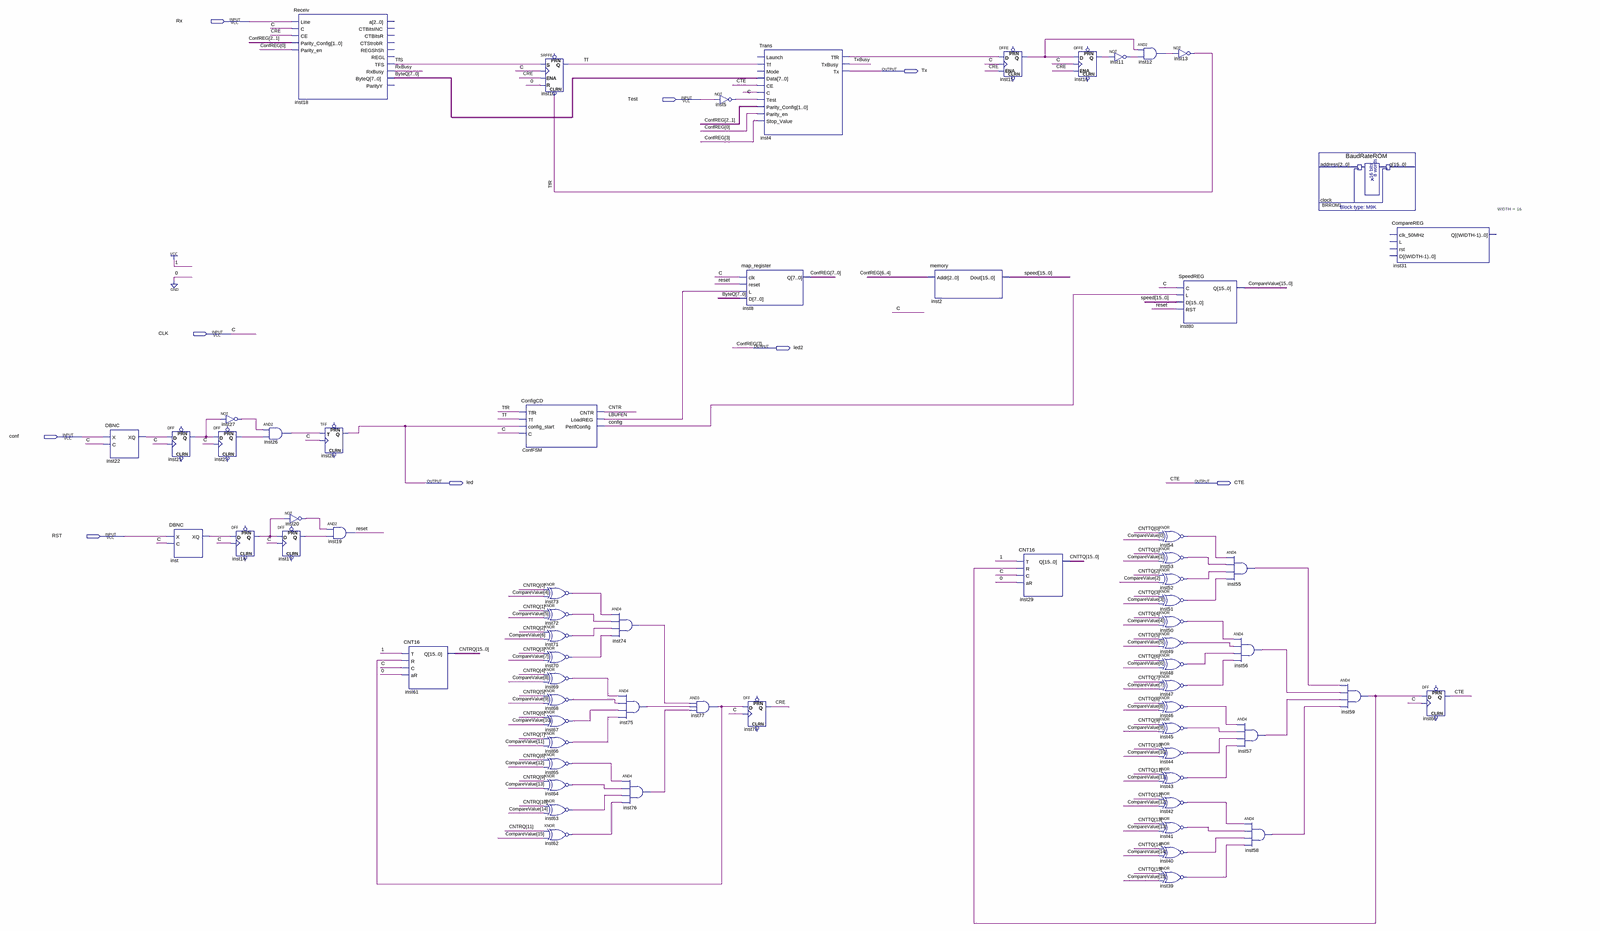
[diagram p0: schematic sheet, whole]
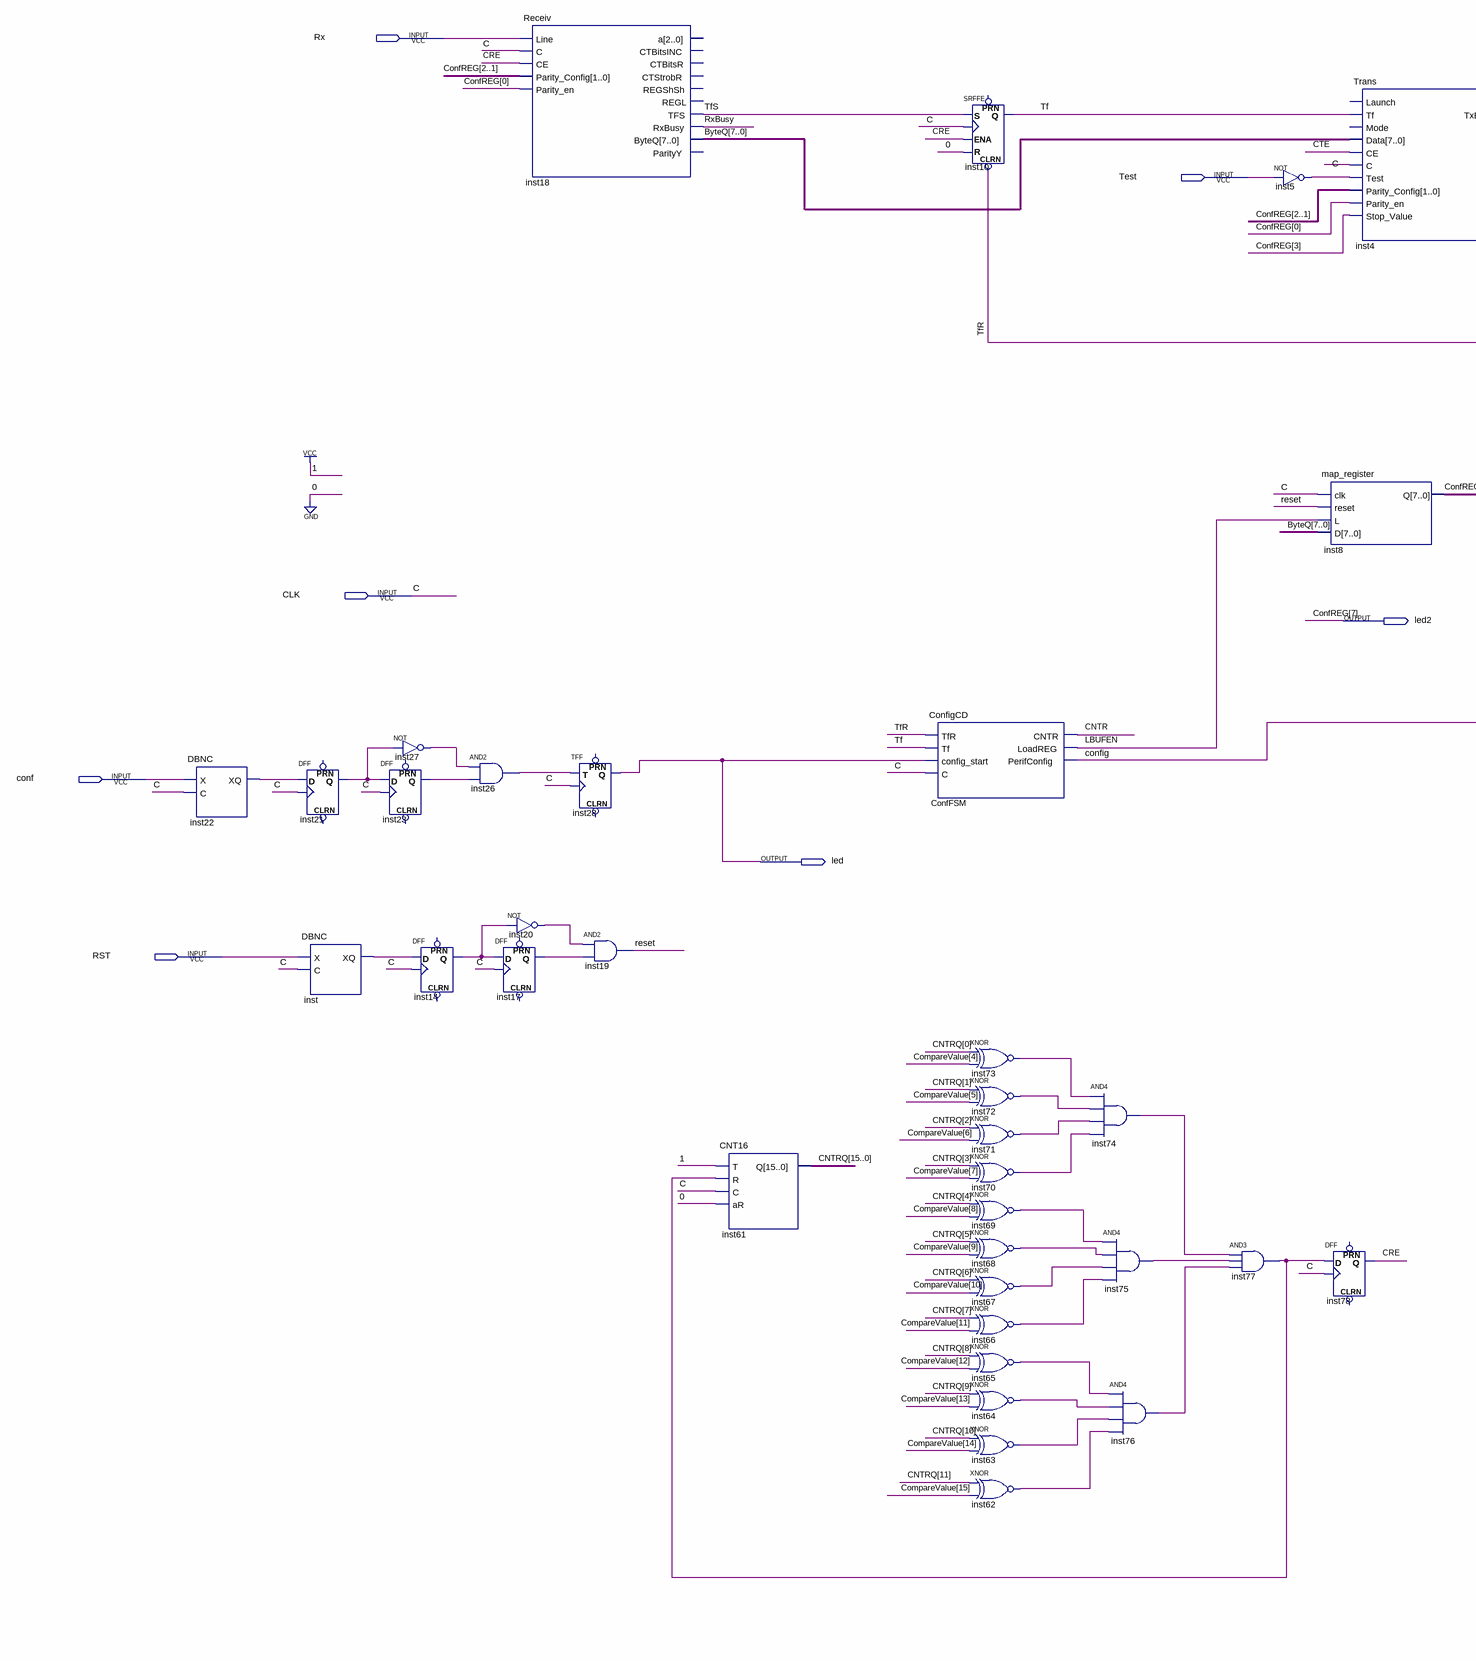
[diagram p1: schematic sheet, left part]
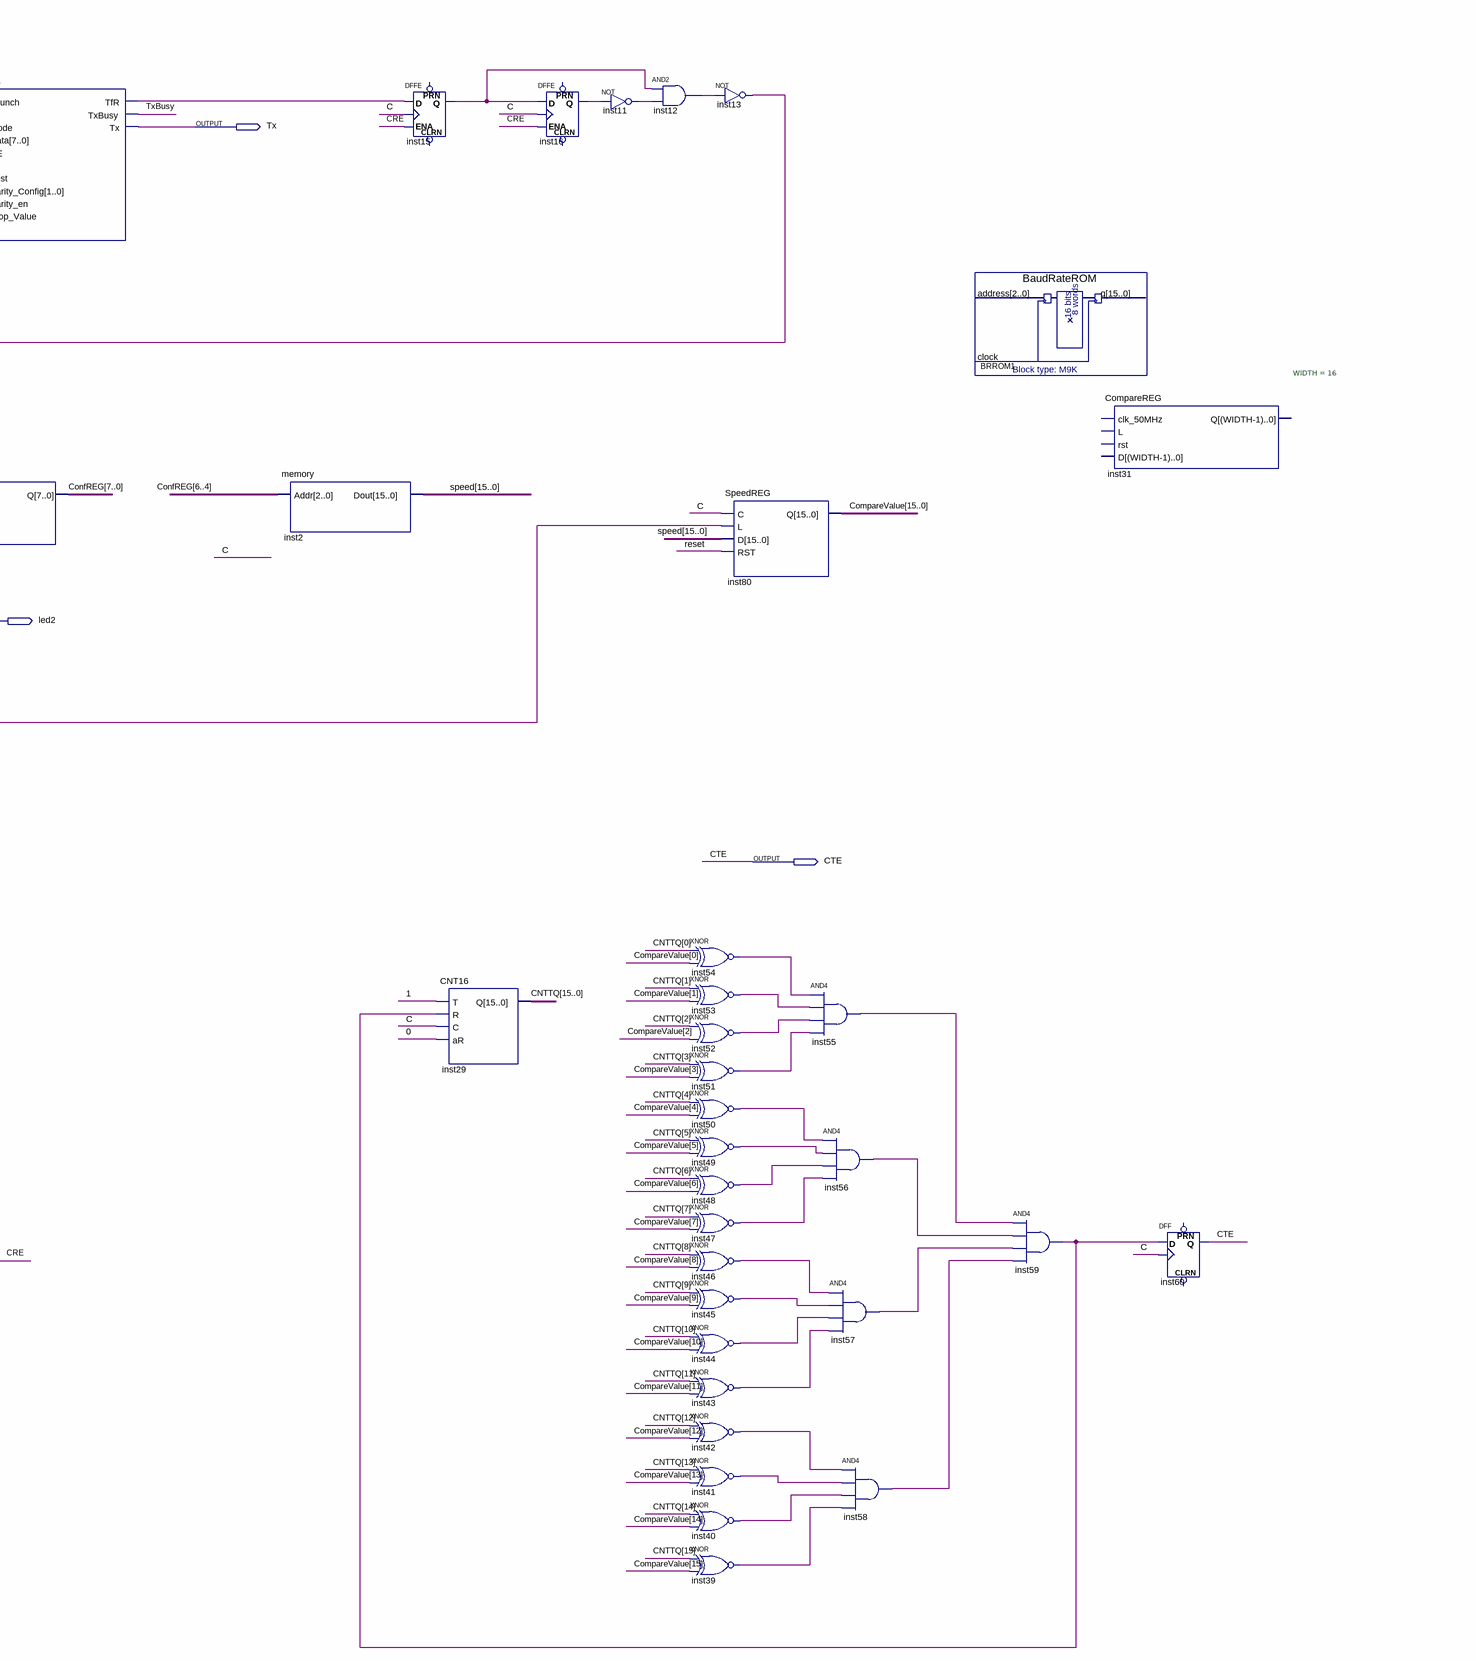
[diagram p2: schematic sheet, right part]
// Quartus schematic transmitter.bdf as structural Verilog: 67 symbols, 9 pins
module transmitter (
  input  Rx,
  input  Test,
  input  CLK,
  input  conf,
  input  RST,
  output Tx,
  output led2,
  output led,
  output CTE
);

  wire CNTR, \config , CRE, inst4_tfr, inst5_out, inst11_out, inst12_out, inst14_q, inst15_q, inst16_q,
       inst17_q, inst20_out, inst21_q, inst22_xq, inst23_q, inst26_out, inst27_out, inst39_out, inst40_out,
       inst41_out, inst42_out, inst43_out, inst44_out, inst45_out, inst46_out, inst47_out, inst48_out,
       inst49_out, inst50_out, inst51_out, inst52_out, inst53_out, inst54_out, inst55_out, inst56_out,
       inst57_out, inst58_out, inst59_out, inst62_out, inst63_out, inst64_out, inst65_out, inst66_out,
       inst67_out, inst68_out, inst69_out, inst70_out, inst71_out, inst72_out, inst73_out, inst74_out,
       inst75_out, inst76_out, inst77_out, inst_xq, LBUFEN, reset, RxBusy, Tf, TfR, TfS, TxBusy;
  wire [6:0] ConfREG;
  wire [7:0] ByteQ;
  wire [15:0] CNTRQ, CNTTQ, CompareValue, speed;

  DBNC inst22 (.X(conf), .C(CLK), .XQ(inst22_xq));
  DFF inst21 (.CLK(CLK), .D(inst22_xq), .Q(inst21_q));  // open: CLRN, PRN
  DBNC inst (.X(RST), .C(CLK), .XQ(inst_xq));
  not inst27 (inst27_out, inst21_q);
  DFF inst23 (.CLK(CLK), .D(inst21_q), .Q(inst23_q));  // open: CLRN, PRN
  DFF inst14 (.CLK(CLK), .D(inst_xq), .Q(inst14_q));  // open: CLRN, PRN
  and inst26 (inst26_out, inst27_out, inst23_q);
  Receiv inst18 (
    .Line(Rx), .C(CLK), .CE(CRE), .Parity_Config(ConfREG[2:1]), .Parity_en(ConfREG[0]), .TFS(TfS),
    .RxBusy(RxBusy), .ByteQ(ByteQ));  // open: a, CTBitsINC, CTBitsR, CTStrobR, REGShSh, REGL, ParityY
  not inst20 (inst20_out, inst14_q);
  DFF inst17 (.CLK(CLK), .D(inst14_q), .Q(inst17_q));  // open: CLRN, PRN
  TFF inst28 (.T(inst26_out), .CLK(CLK), .Q(led));  // open: PRN, CLRN
  and inst19 (reset, inst20_out, inst17_q);
  CNT16 inst61 (.T(1'b1), .R(inst77_out), .C(CLK), .aR(1'b0), .Q(CNTRQ));
  ConfigCD ConfFSM (
    .TfR(TfR), .Tf(Tf), .config_start(led), .C(CLK), .CNTR(CNTR), .LoadREG(LBUFEN), .PerifConfig(\config ));
  SRFFE inst10 (.S(TfS), .CLK(CLK), .CLRN(TfR), .R(1'b0), .ENA(CRE), .Q(Tf));  // open: PRN
  xnor inst73 (inst73_out, CNTRQ[0], CompareValue[4]);
  xnor inst72 (inst72_out, CNTRQ[1], CompareValue[5]);
  xnor inst71 (inst71_out, CNTRQ[2], CompareValue[6]);
  xnor inst70 (inst70_out, CNTRQ[3], CompareValue[7]);
  xnor inst69 (inst69_out, CNTRQ[4], CompareValue[8]);
  xnor inst68 (inst68_out, CNTRQ[5], CompareValue[9]);
  xnor inst67 (inst67_out, CNTRQ[6], CompareValue[10]);
  xnor inst66 (inst66_out, CNTRQ[7], CompareValue[11]);
  xnor inst65 (inst65_out, CNTRQ[8], CompareValue[12]);
  xnor inst64 (inst64_out, CNTRQ[9], CompareValue[13]);
  xnor inst63 (inst63_out, CNTRQ[10], CompareValue[14]);
  xnor inst62 (inst62_out, CNTRQ[11], CompareValue[15]);
  and inst74 (inst74_out, inst73_out, inst72_out, inst71_out, inst70_out);
  and inst75 (inst75_out, inst69_out, inst68_out, inst67_out, inst66_out);
  and inst76 (inst76_out, inst65_out, inst64_out, inst63_out, inst62_out);
  and inst77 (inst77_out, inst74_out, inst75_out, inst76_out);
  not inst5 (inst5_out, Test);
  map_register inst8 (.clk(CLK), .reset(reset), .L(LBUFEN), .D(ByteQ), .Q({led2, ConfREG}));
  DFF inst78 (.CLK(CLK), .D(inst77_out), .Q(CRE));  // open: CLRN, PRN
  Trans inst4 (
    .Tf(Tf), .Data(ByteQ), .CE(CTE), .C(CLK), .Test(inst5_out), .Parity_Config(ConfREG[2:1]),
    .Parity_en(ConfREG[0]), .Stop_Value(ConfREG[3]), .TfR(inst4_tfr), .TxBusy(TxBusy), .Tx(Tx));  // open: Launch, Mode
  memory inst2 (.Addr(ConfREG[6:4]), .Dout(speed));
  DFFE inst15 (.D(inst4_tfr), .CLK(CLK), .ENA(CRE), .Q(inst15_q));  // open: PRN, CLRN
  CNT16 inst29 (.T(1'b1), .R(inst59_out), .C(CLK), .aR(1'b0), .Q(CNTTQ));
  DFFE inst16 (.D(inst15_q), .CLK(CLK), .ENA(CRE), .Q(inst16_q));  // open: PRN, CLRN
  not inst11 (inst11_out, inst16_q);
  and inst12 (inst12_out, inst15_q, inst11_out);
  not inst13 (TfR, inst12_out);
  xnor inst54 (inst54_out, CNTTQ[0], CompareValue[0]);
  xnor inst53 (inst53_out, CNTTQ[1], CompareValue[1]);
  xnor inst52 (inst52_out, CNTTQ[2], CompareValue[2]);
  xnor inst51 (inst51_out, CNTTQ[3], CompareValue[3]);
  xnor inst50 (inst50_out, CNTTQ[4], CompareValue[4]);
  xnor inst49 (inst49_out, CNTTQ[5], CompareValue[5]);
  xnor inst48 (inst48_out, CNTTQ[6], CompareValue[6]);
  xnor inst47 (inst47_out, CNTTQ[7], CompareValue[7]);
  xnor inst46 (inst46_out, CNTTQ[8], CompareValue[8]);
  xnor inst45 (inst45_out, CNTTQ[9], CompareValue[9]);
  xnor inst44 (inst44_out, CNTTQ[10], CompareValue[10]);
  xnor inst43 (inst43_out, CNTTQ[11], CompareValue[11]);
  xnor inst42 (inst42_out, CNTTQ[12], CompareValue[12]);
  xnor inst41 (inst41_out, CNTTQ[13], CompareValue[13]);
  xnor inst40 (inst40_out, CNTTQ[14], CompareValue[14]);
  xnor inst39 (inst39_out, CNTTQ[15], CompareValue[15]);
  SpeedREG inst80 (.C(CLK), .L(\config ), .D(speed), .RST(reset), .Q(CompareValue));
  and inst55 (inst55_out, inst54_out, inst53_out, inst52_out, inst51_out);
  and inst56 (inst56_out, inst50_out, inst49_out, inst48_out, inst47_out);
  and inst57 (inst57_out, inst46_out, inst45_out, inst44_out, inst43_out);
  and inst58 (inst58_out, inst42_out, inst41_out, inst40_out, inst39_out);
  BaudRateROM BRROM1 ();  // open: address, clock, q
  and inst59 (inst59_out, inst55_out, inst56_out, inst57_out, inst58_out);
  CompareREG #(.WIDTH(16)) inst31 ();  // open: clk_50MHz, L, rst, D, Q
  DFF inst60 (.CLK(CLK), .D(inst59_out), .Q(CTE));  // open: CLRN, PRN

  // Other names for the same wires on the sheet: C = CLK; ConfREG[7] = led2
endmodule
